# EAGLE design xport-v92-audiobridge (EAGLE 9.6.2)
POTS Audio Bridge: Bridges a telephone line to a sound card microphone input and an agent headset, through a 600:600 ohm wet isolation transformer and a resistive hybrid.
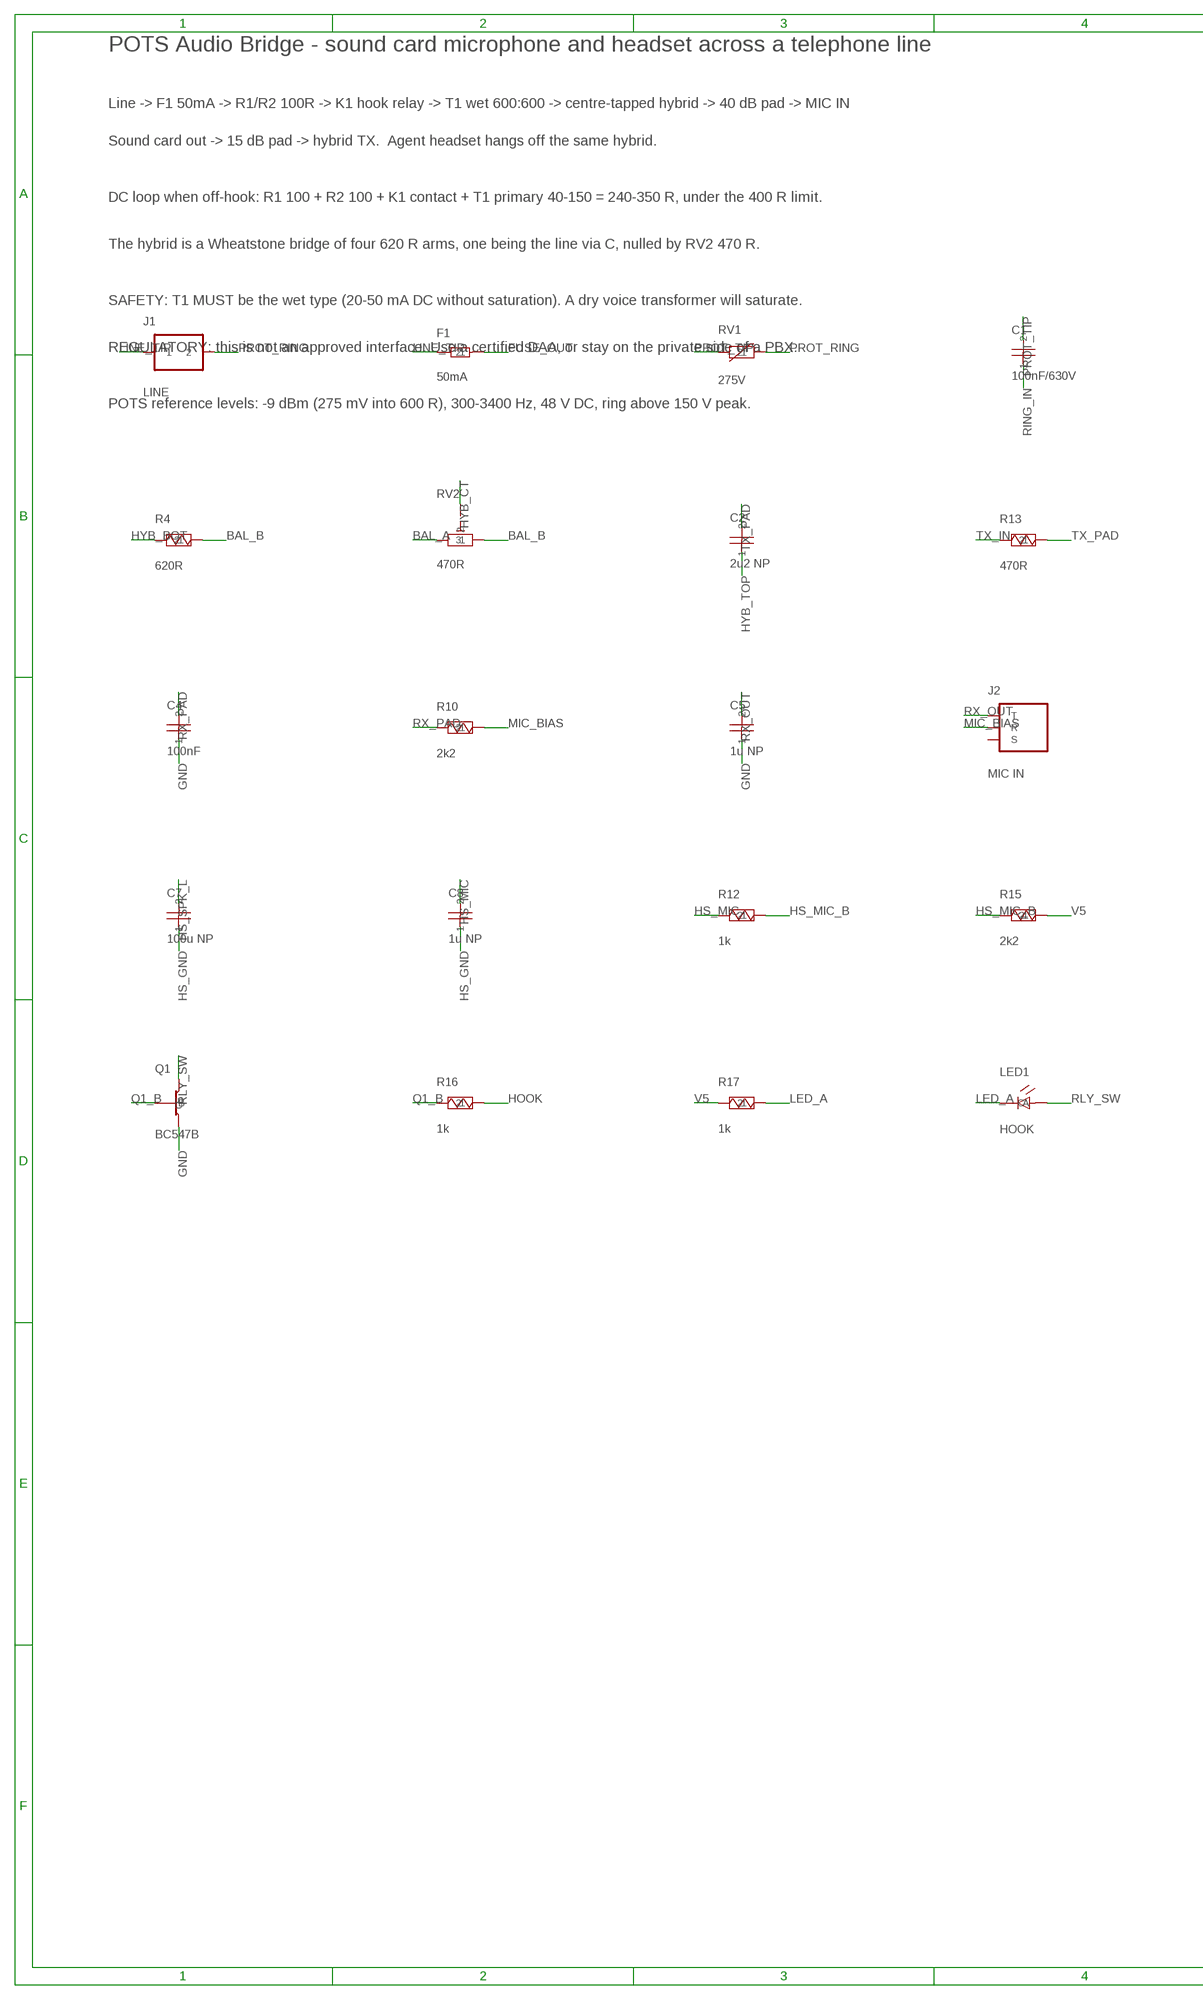
[diagram p0: schematic, sheet 1, part 1 of 2]
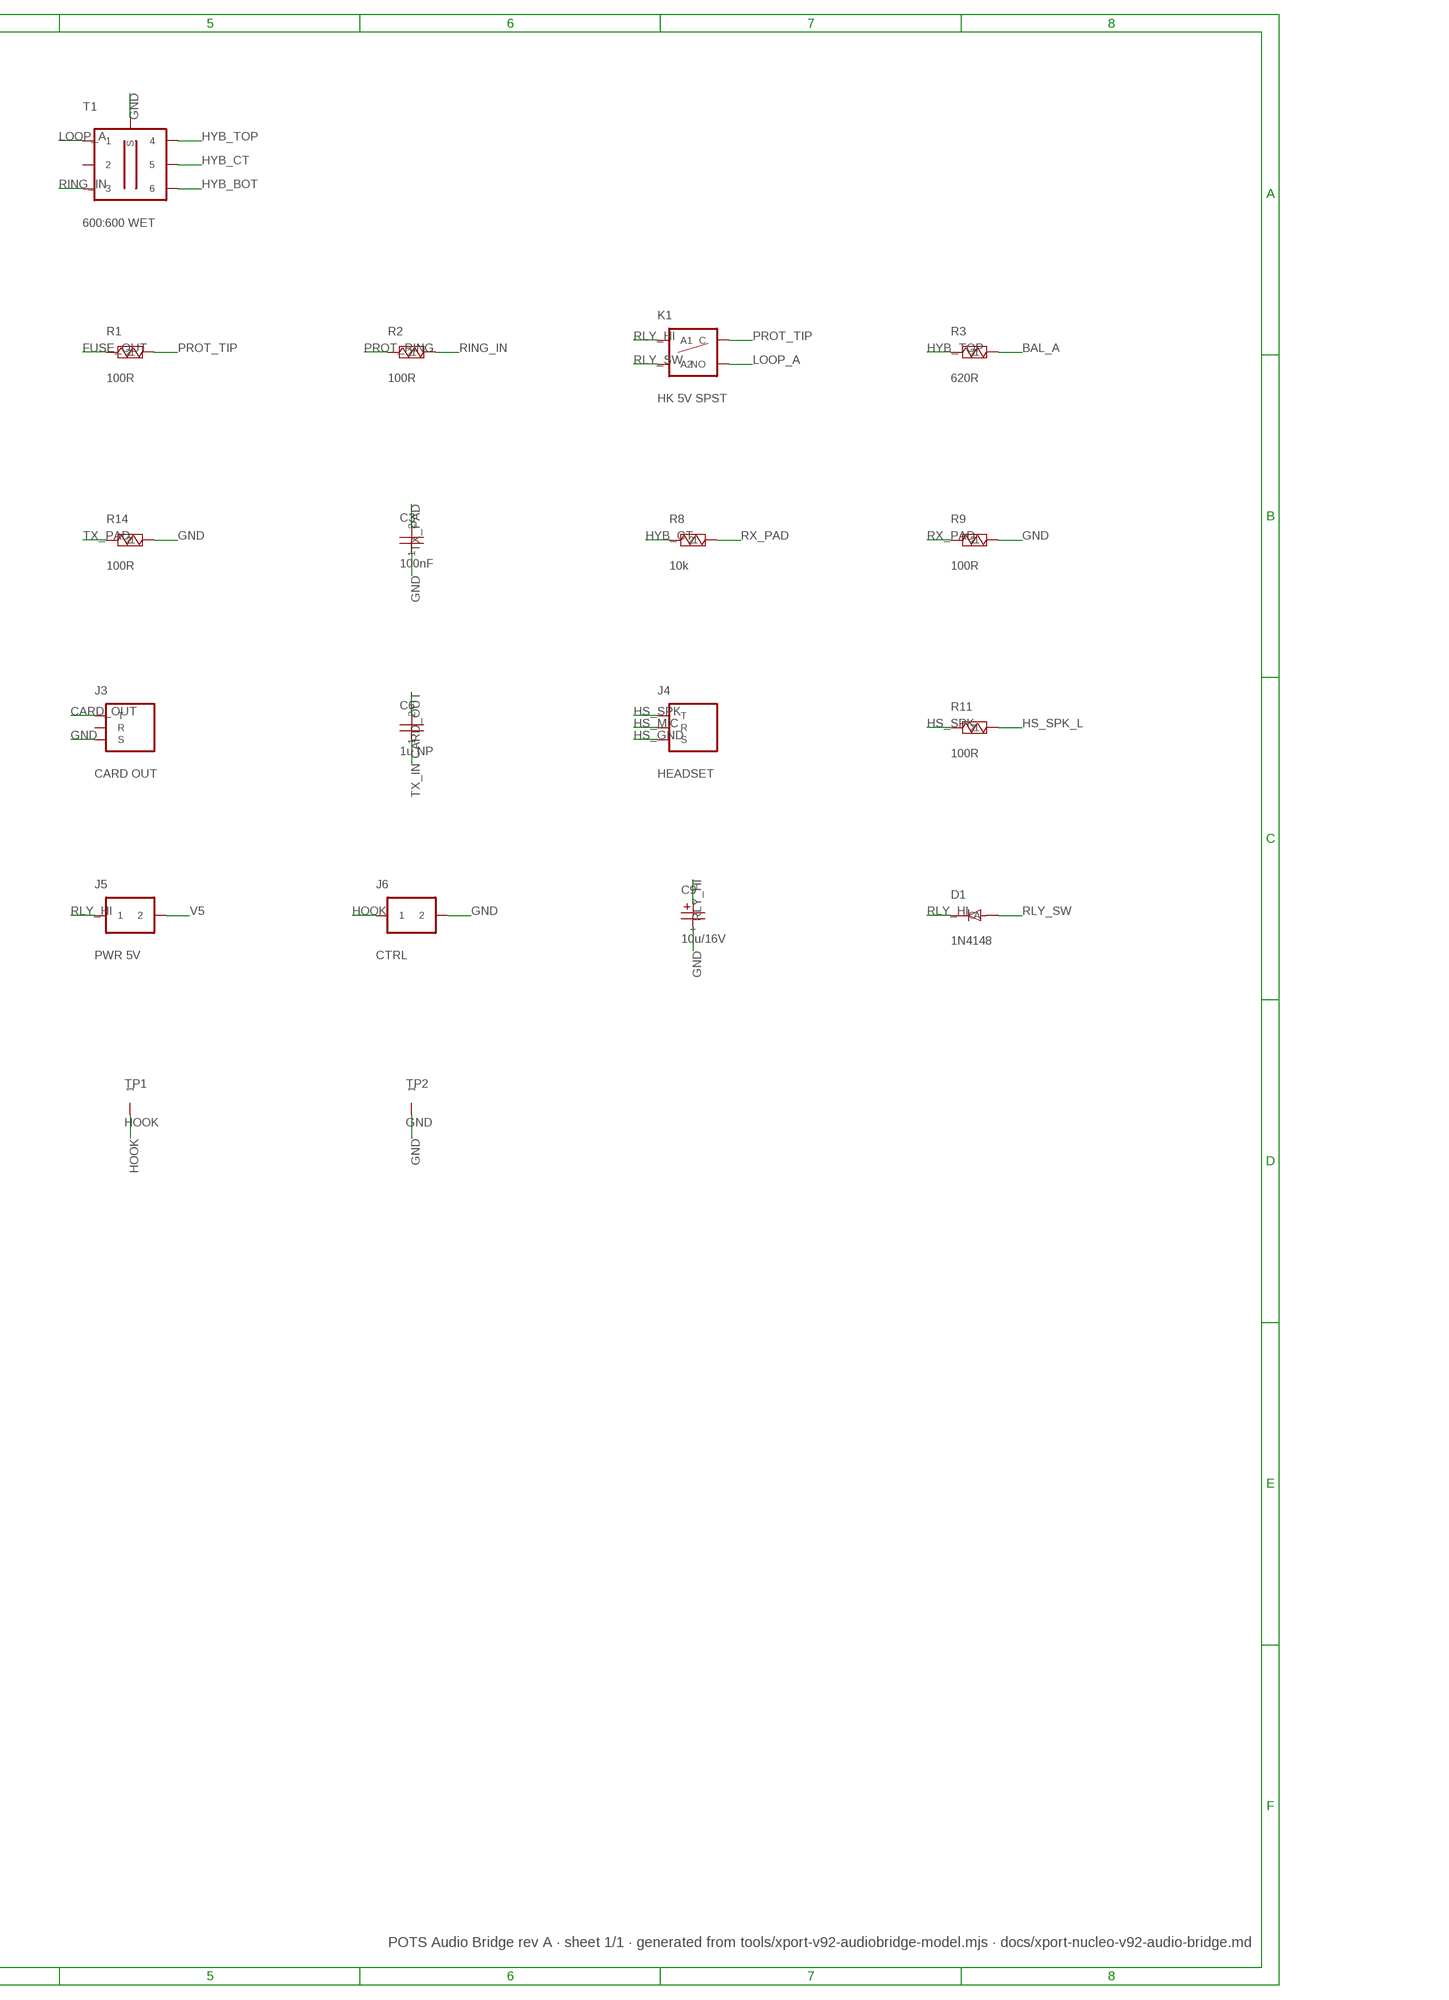
[diagram p1: schematic, sheet 1, part 2 of 2]

## Parts
C1  100nF/630V  C-EU  [C-5.08]
C2  2u2 NP  C-EU  [C-5.08]
C3  100nF  C-EU  [C-5.08]
C4  100nF  C-EU  [C-5.08]
C5  1u NP  C-EU  [C-5.08]
C6  1u NP  C-EU  [C-5.08]
C7  100u NP  C-EU  [C-5.08]
C8  1u NP  C-EU  [C-5.08]
C9  10u/16V  CPOL-EU  [CP-D8-P3.5]
D1  1N4148  DIODE-SCH  [DO41]
F1  50mA  FUSE  [R-7.62]
J1  LINE  TERM-2  [TERM2-5.08]
J2  MIC IN  JACK-TRS  [JACK-3P5]
J3  CARD OUT  JACK-TRS  [JACK-3P5]
J4  HEADSET  JACK-TRS  [JACK-3P5]
J5  PWR 5V  TERM-2  [TERM2-5.08]
J6  CTRL  TERM-2  [TERM2-5.08]
K1  HK 5V SPST  RELAY  [RELAY-SPST]
LED1  HOOK  LED  [LED-5MM]
Q1  BC547B  NPN  [TO92]
R1  100R  R-EU  [R-7.62]
R2  100R  R-EU  [R-7.62]
R3  620R  R-EU  [R-7.62]
R4  620R  R-EU  [R-7.62]
R8  10k  R-EU  [R-7.62]
R9  100R  R-EU  [R-7.62]
R10  2k2  R-EU  [R-7.62]
R11  100R  R-EU  [R-7.62]
R12  1k  R-EU  [R-7.62]
R13  470R  R-EU  [R-7.62]
R14  100R  R-EU  [R-7.62]
R15  2k2  R-EU  [R-7.62]
R16  1k  R-EU  [R-7.62]
R17  1k  R-EU  [R-7.62]
RV1  275V  VARISTOR  [MOV-7.62]
RV2  470R  TRIM  [TRIM-3P]
T1  600:600 WET  XFMR-600  [XFMR-600]
TP1  HOOK  TP  [TP]
TP2  GND  TP  [TP]

## Nets
BAL_A: R3.2 RV2.1
BAL_B: R4.2 RV2.3
CARD_OUT: C6.1 J3.1(T)
FUSE_OUT: F1.2 R1.1
GND: C3.2 C4.2 C5.2 C9.2(-) J3.3(S) J6.2 Q1.3(E) R9.2 R14.2 T1.S TP2.1
HOOK: J6.1 R16.2 TP1.1
HS_GND: C7.2 C8.2 J4.3(S)
HS_MIC: C8.1 J4.2(R) R12.1
HS_MIC_B: R12.2 R15.1
HS_SPK: J4.1(T) R11.1
HS_SPK_L: C7.1 R11.2
HYB_BOT: R4.1 T1.6
HYB_CT: R8.1 RV2.2 T1.5
HYB_TOP: C2.2 R3.1 T1.4
LED_A: LED1.1(A) R17.2
LINE_TIP: F1.1 J1.1
LOOP_A: K1.4(NO) T1.1
MIC_BIAS: J2.2(R) R10.2
PROT_RING: J1.2 R2.1 RV1.2
PROT_TIP: C1.1 K1.3(C) R1.2 RV1.1
Q1_B: Q1.1(B) R16.1
RING_IN: C1.2 R2.2 T1.3
RLY_HI: C9.1(+) D1.1(A) J5.1 K1.1(A1)
RLY_SW: D1.2(C) K1.2(A2) LED1.2(C) Q1.2(C)
RX_OUT: C5.1 J2.1(T)
RX_PAD: C4.1 R8.2 R9.1 R10.1
TX_IN: C6.2 R13.1
TX_PAD: C2.1 C3.1 R13.2 R14.1
V5: J5.2 R15.2 R17.1
Unconnected: J2.3(S) J3.2(R) T1.2

## Notes on the sheet
- POTS Audio Bridge - sound card microphone and headset across a telephone line
- Line -> F1 50mA -> R1/R2 100R -> K1 hook relay -> T1 wet 600:600 -> centre-tapped hybrid -> 40 dB pad -> MIC IN
- Sound card out -> 15 dB pad -> hybrid TX.  Agent headset hangs off the same hybrid.
- DC loop when off-hook: R1 100 + R2 100 + K1 contact + T1 primary 40-150 = 240-350 R, under the 400 R limit.
- The hybrid is a Wheatstone bridge of four 620 R arms, one being the line via C, nulled by RV2 470 R.
- SAFETY: T1 MUST be the wet type (20-50 mA DC without saturation). A dry voice transformer will saturate.
- REGULATORY: this is not an approved interface. Use a certified DAA, or stay on the private side of a PBX.
- POTS reference levels: -9 dBm (275 mV into 600 R), 300-3400 Hz, 48 V DC, ring above 150 V peak.
- POTS Audio Bridge rev A · sheet 1/1 · generated from tools/xport-v92-audiobridge-model.mjs · docs/xport-nucleo-v92-audio-bridge.md

## Library data of the parts
C1-C8 = xport-v92-audiobridge:C-EU
C9 = xport-v92-audiobridge:CPOL-EU
D1 = xport-v92-audiobridge:DIODE-SCH
F1 = xport-v92-audiobridge:FUSE
J1 J5 J6 = xport-v92-audiobridge:TERM-2
J2-J4 = xport-v92-audiobridge:JACK-TRS
K1 = xport-v92-audiobridge:RELAY
LED1 = xport-v92-audiobridge:LED
Q1 = xport-v92-audiobridge:NPN
R1-R4 R8-R17 = xport-v92-audiobridge:R-EU
RV1 = xport-v92-audiobridge:VARISTOR
RV2 = xport-v92-audiobridge:TRIM
T1 = xport-v92-audiobridge:XFMR-600
TP1 TP2 = xport-v92-audiobridge:TP

## Net classes
0 default: width 0.305 mm
1 mains: width 2.5 mm, clearance 3 mm to class 0, clearance 3 mm, clearance 3 mm to class 2
2 power: width 1 mm, clearance 0.5 mm to class 0, clearance 0.6 mm

## Board
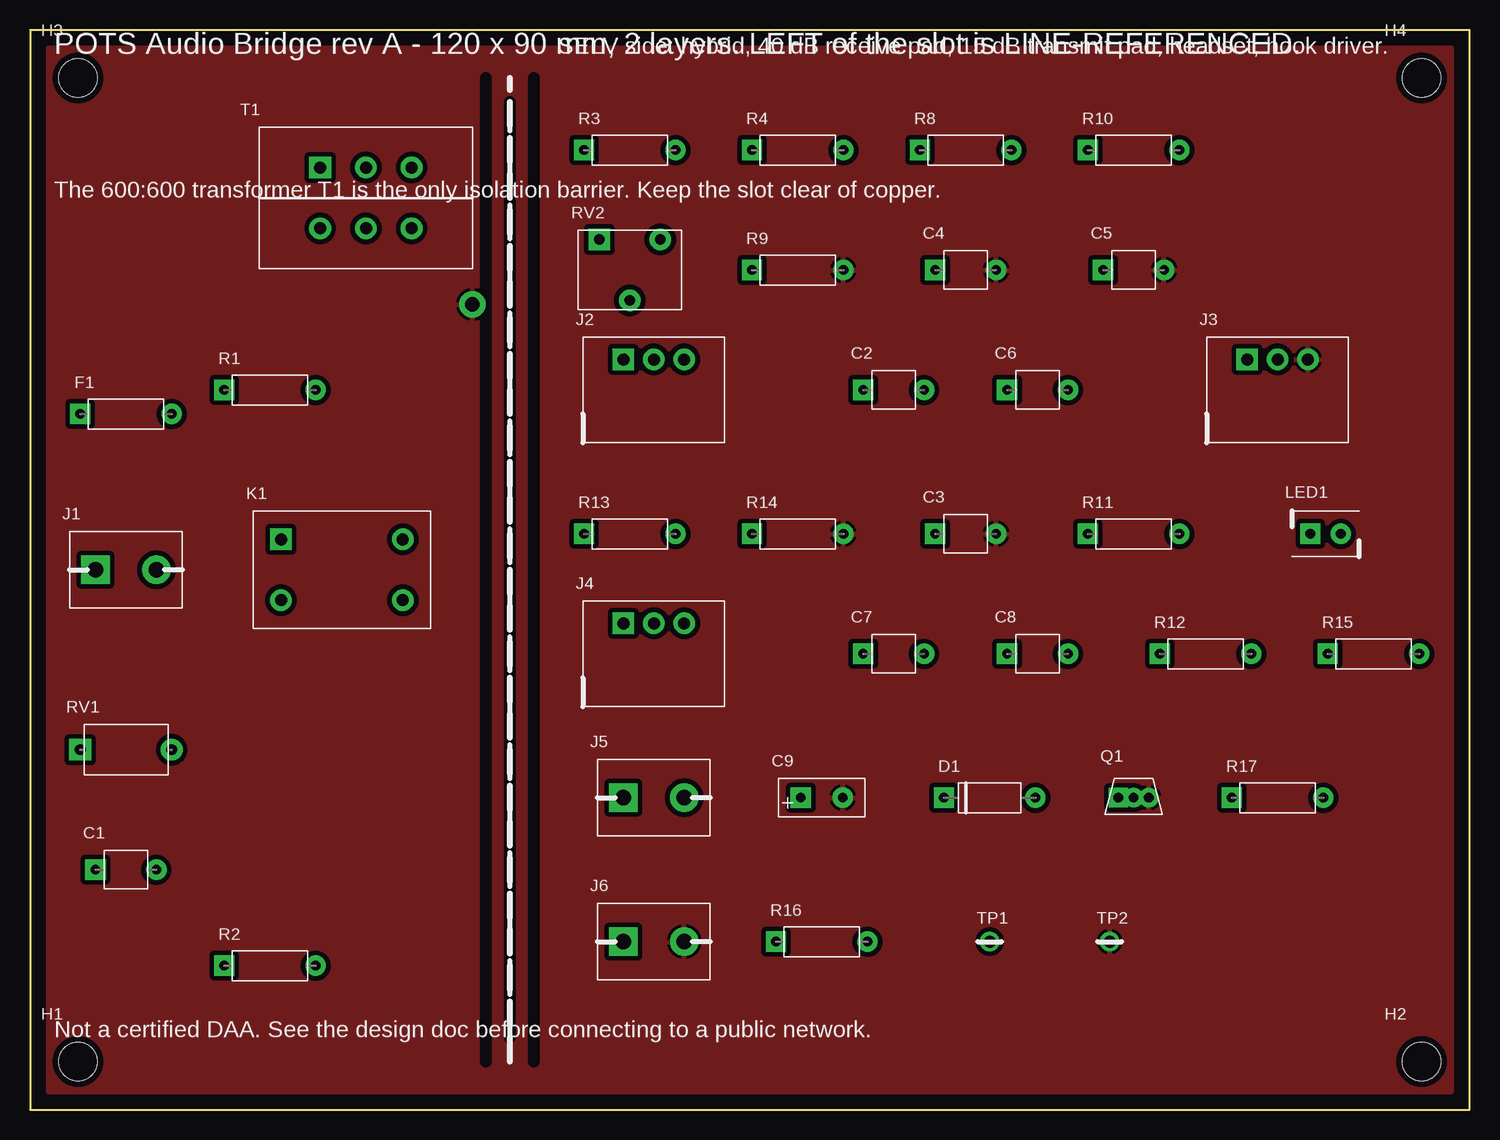
[diagram p2: board, top side]
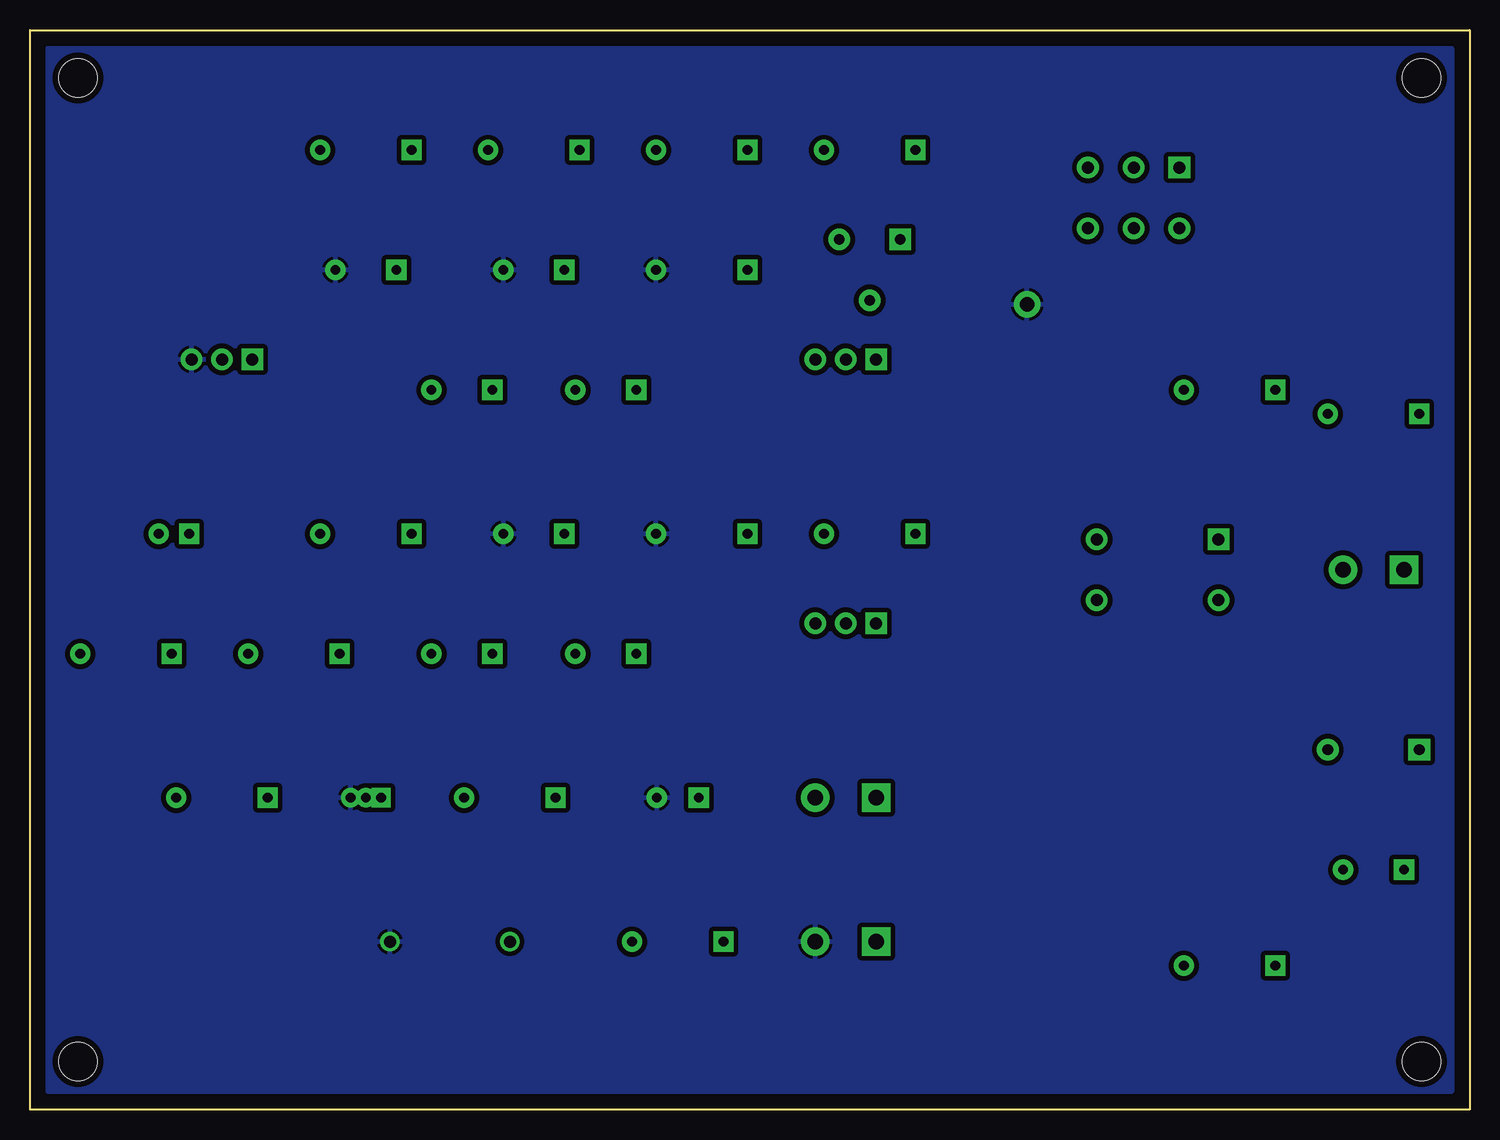
[diagram p3: board, bottom side, seen from below]

Size 120 x 90 mm. Coordinates in mm from the lower left corner, seen from the top.
Outline: 0,0 120,0 120,90 0,90 0,0
Copper layers (1*16): Top 0.035mm / dielectric 1.5mm / Bottom 0.035mm
Design rules "xport-v92-audiobridge-2layer": minimum track width 8mil, minimum drill 0.35mm, track to track 8mil, track to pad 8mil, pad to pad 8mil, via to via 8mil, smd to smd 0mil, copper to edge 20mil, drill to drill 8mil, minimum pad ring 10mil, minimum via ring 8mil, stop-mask expansion 4mil, vias tented up to drill 25mil, thermal gap 10mil
tRestrict: 3 lines

### Footprints (pad centres in the part's own frame; a part is rotated, then mirrored left to right if it is on the bottom)
C-5.08 = drill 0.8 pad 1.7 square: 1 -2.54,0 | drill 0.8 pad 1.7: 2 2.54,0
CP-D8-P3.5 = drill 0.8 pad 1.7 square: 1 -1.75,0 | drill 0.8 pad 1.7: 2 1.75,0
DO41 = drill 0.8 pad 1.7 square: 1 -3.81,0 | drill 0.8 pad 1.7: 2 3.81,0
R-7.62 = drill 0.8 pad 1.7 square: 1 -3.81,0 | drill 0.8 pad 1.7: 2 3.81,0
MOUNT-M3 = hole 3.2: 0,0
TERM2-5.08 = drill 1.3 pad 2.4 square: 1 -2.54,0 | drill 1.3 pad 2.4: 2 2.54,0
JACK-3P5 = drill 1 pad 1.8 square: 1 -2.54,2.54 | drill 1 pad 1.8: 2 0,2.54; 3 2.54,2.54
RELAY-SPST = drill 1 pad 1.8 square: 1 -5.08,2.54 | drill 1 pad 1.8: 2 -5.08,-2.54; 3 5.08,2.54; 4 5.08,-2.54
LED-5MM = drill 0.8 pad 1.7 square: 1 -1.27,0 | drill 0.8 pad 1.7: 2 1.27,0
TO92 = drill 0.8 pad 1.6 square: 1 -1.27,0 | drill 0.8 pad 1.6: 2 0,0; 3 1.27,0
MOV-7.62 = drill 0.9 pad 1.8 square: 1 -3.81,0 | drill 0.9 pad 1.8: 2 3.81,0
TRIM-3P = drill 0.9 pad 1.8 square: 1 -2.54,2.54 | drill 0.9 pad 1.8: 2 0,-2.54; 3 2.54,2.54
XFMR-600 = drill 1 pad 1.8 square: 1 -3.81,2.54 | drill 1 pad 1.8: 2 0,2.54; 3 3.81,2.54; 4 3.81,-2.54; 5 0,-2.54; 6 -3.81,-2.54 | drill 1.2 pad 2.2: S 8.89,-8.89
TP = drill 1 pad 1.6: 1 0,0

### Placement (x,y rotation side)
C1  8,20 0 top
C2  72,60 0 top
C3  78,48 0 top
C4  78,70 0 top
C5  92,70 0 top
C6  84,60 0 top
C7  72,38 0 top
C8  84,38 0 top
C9  66,26 0 top
D1  80,26 0 top
F1  8,58 0 top
H1  [MOUNT-M3]  4,4 0 top
H2  [MOUNT-M3]  116,4 0 top
H3  [MOUNT-M3]  4,86 0 top
H4  [MOUNT-M3]  116,86 0 top
J1  8,45 0 top
J2  52,60 0 top
J3  104,60 0 top
J4  52,38 0 top
J5  52,26 0 top
J6  52,14 0 top
K1  26,45 0 top
LED1  108,48 0 top
Q1  92,26 0 top
R1  20,60 0 top
R2  20,12 0 top
R3  50,80 0 top
R4  64,80 0 top
R8  78,80 0 top
R9  64,70 0 top
R10  92,80 0 top
R11  92,48 0 top
R12  98,38 0 top
R13  50,48 0 top
R14  64,48 0 top
R15  112,38 0 top
R16  66,14 0 top
R17  104,26 0 top
RV1  8,30 0 top
RV2  50,70 0 top
T1  28,76 0 top
TP1  80,14 0 top
TP2  90,14 0 top

### Tracks (layer width: path | path; a pad name or v marks a point on that pad's centre or on a via)
GND
  pour Top (isolate 0.4, rank 2): 1.5,1.5 118.5,1.5 118.5,88.5 1.5,88.5
  pour Bottom (isolate 0.4, rank 2): 1.5,1.5 118.5,1.5 118.5,88.5 1.5,88.5

### Text on the board
tPlace: POTS Audio Bridge rev A - 120 x 90 mm, 2 layers. LEFT of the slot is LINE-REFERENCED. | SELV side: hybrid, 40 dB receive pad, 15 dB transmit pad, headset, hook driver. | The 600:600 transformer T1 is the only isolation barrier. Keep the slot clear of copper. | Not a certified DAA. See the design doc before connecting to a public network.